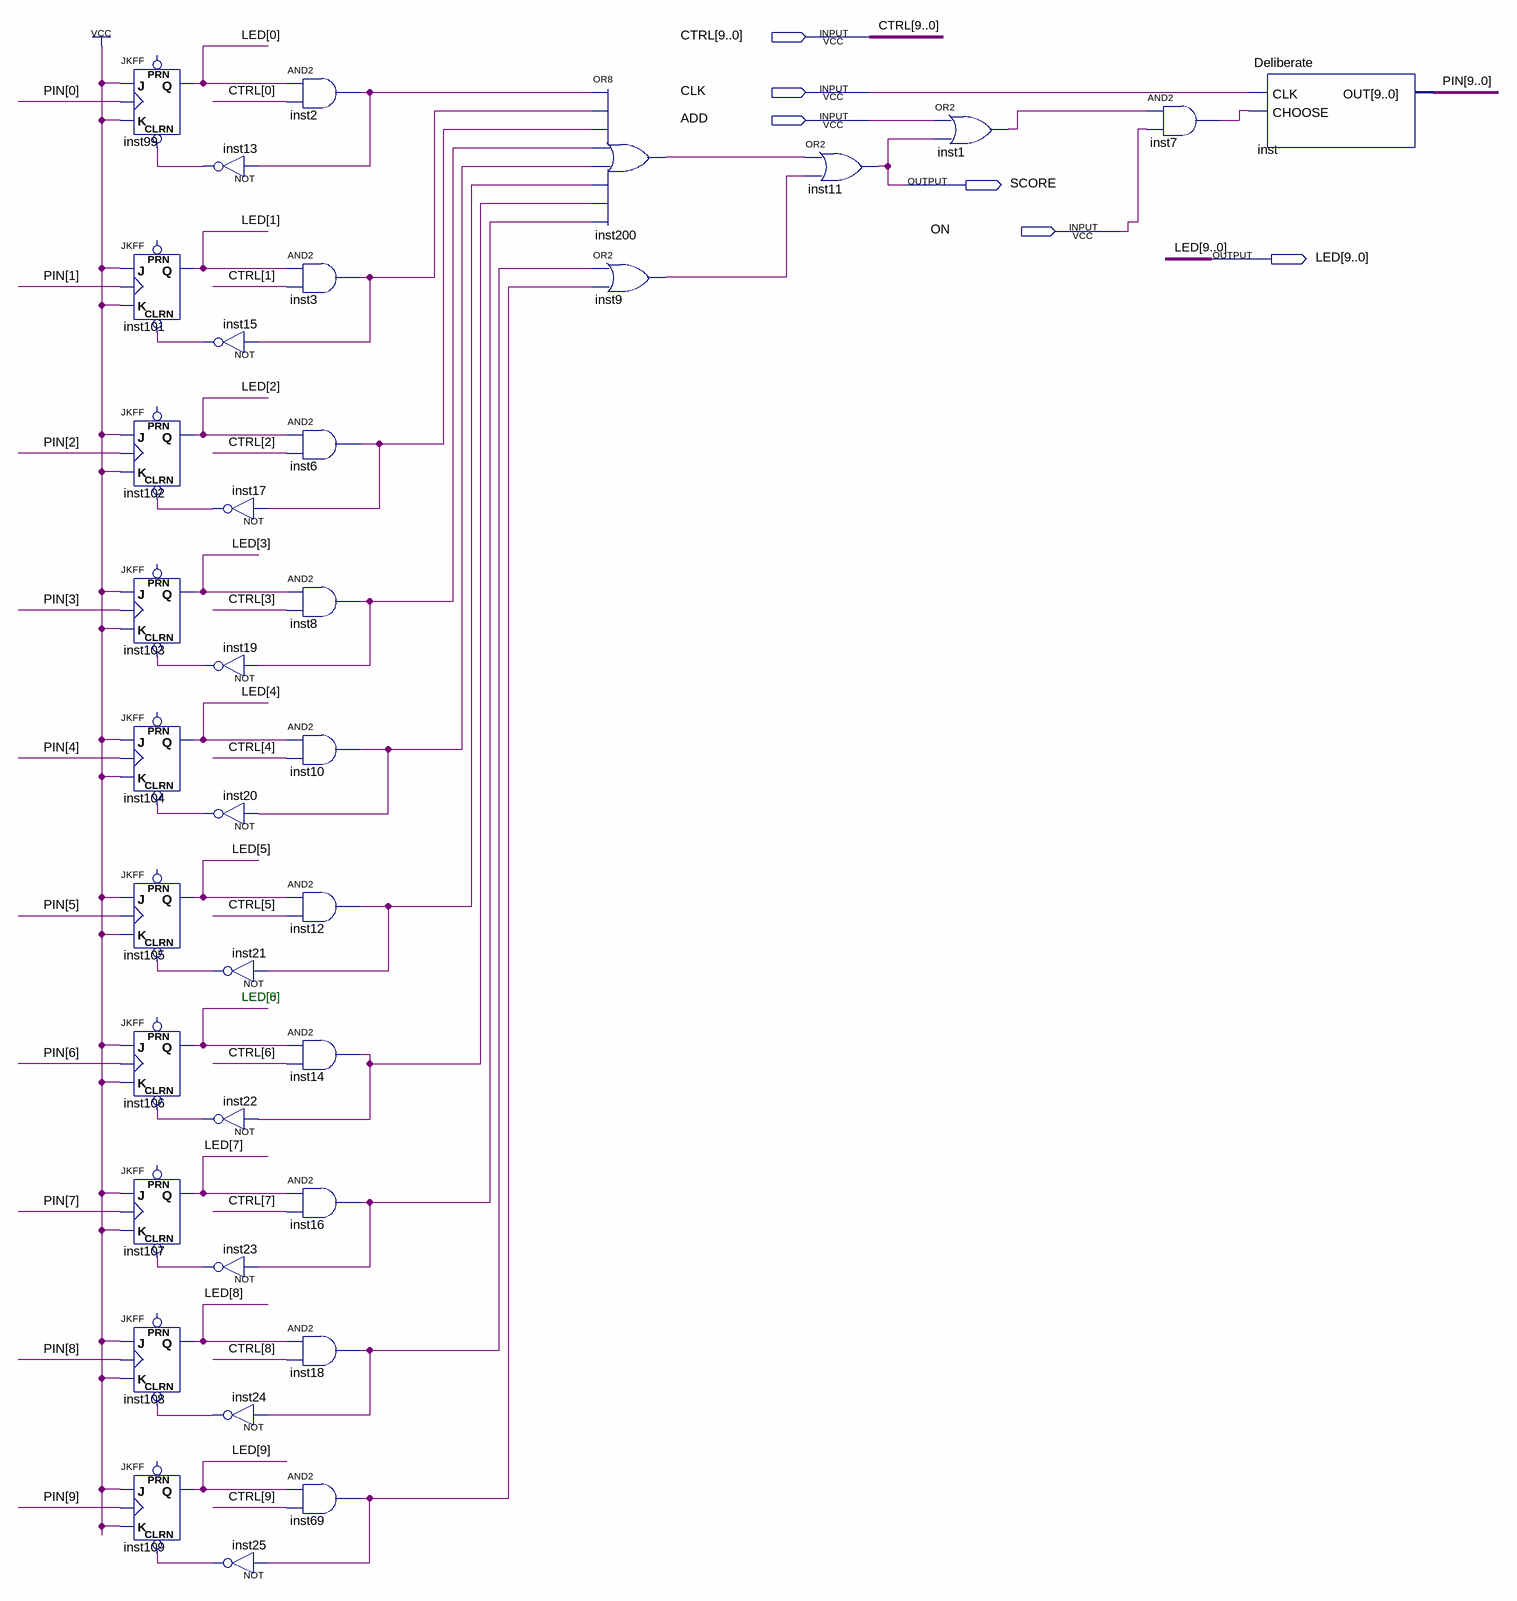
[diagram p0: schematic sheet]
// Quartus schematic Game.bdf as structural Verilog: 36 symbols, 6 pins
module Game (
  input  [9:0] CTRL,
  input  CLK,
  input  ADD,
  input  ON,
  output SCORE,
  output [9:0] LED
);

  wire inst1_out, inst2_out, inst3_out, inst6_out, inst7_out, inst8_out, inst9_out, inst10_out, inst12_out,
       inst13_out, inst14_out, inst15_out, inst16_out, inst17_out, inst18_out, inst19_out, inst20_out,
       inst21_out, inst22_out, inst23_out, inst24_out, inst25_out, inst69_out, inst200_out;
  wire [9:0] PIN;

  JKFF inst99 (.CLRN(inst13_out), .K(1'b1), .J(1'b1), .CLK(PIN[0]), .Q(LED[0]));  // open: PRN
  JKFF inst101 (.CLRN(inst15_out), .K(1'b1), .J(1'b1), .CLK(PIN[1]), .Q(LED[1]));  // open: PRN
  JKFF inst102 (.CLRN(inst17_out), .K(1'b1), .J(1'b1), .CLK(PIN[2]), .Q(LED[2]));  // open: PRN
  JKFF inst103 (.CLRN(inst19_out), .K(1'b1), .J(1'b1), .CLK(PIN[3]), .Q(LED[3]));  // open: PRN
  JKFF inst104 (.CLRN(inst20_out), .K(1'b1), .J(1'b1), .CLK(PIN[4]), .Q(LED[4]));  // open: PRN
  JKFF inst105 (.CLRN(inst21_out), .K(1'b1), .J(1'b1), .CLK(PIN[5]), .Q(LED[5]));  // open: PRN
  JKFF inst106 (.CLRN(inst22_out), .K(1'b1), .J(1'b1), .CLK(PIN[6]), .Q(LED[6]));  // open: PRN
  JKFF inst107 (.CLRN(inst23_out), .K(1'b1), .J(1'b1), .CLK(PIN[7]), .Q(LED[7]));  // open: PRN
  JKFF inst108 (.CLRN(inst24_out), .K(1'b1), .J(1'b1), .CLK(PIN[8]), .Q(LED[8]));  // open: PRN
  JKFF inst109 (.CLRN(inst25_out), .K(1'b1), .J(1'b1), .CLK(PIN[9]), .Q(LED[9]));  // open: PRN
  not inst13 (inst13_out, inst2_out);
  not inst15 (inst15_out, inst3_out);
  not inst17 (inst17_out, inst6_out);
  not inst19 (inst19_out, inst8_out);
  not inst20 (inst20_out, inst10_out);
  not inst21 (inst21_out, inst12_out);
  not inst22 (inst22_out, inst14_out);
  not inst23 (inst23_out, inst16_out);
  not inst24 (inst24_out, inst18_out);
  not inst25 (inst25_out, inst69_out);
  and inst2 (inst2_out, LED[0], CTRL[0]);
  and inst3 (inst3_out, LED[1], CTRL[1]);
  and inst6 (inst6_out, LED[2], CTRL[2]);
  and inst8 (inst8_out, LED[3], CTRL[3]);
  and inst10 (inst10_out, LED[4], CTRL[4]);
  and inst12 (inst12_out, LED[5], CTRL[5]);
  and inst14 (inst14_out, LED[6], CTRL[6]);
  and inst16 (inst16_out, LED[7], CTRL[7]);
  and inst18 (inst18_out, LED[8], CTRL[8]);
  and inst69 (inst69_out, LED[9], CTRL[9]);
  or inst200 (inst200_out, inst2_out, inst3_out, inst6_out, inst8_out, inst10_out, inst12_out, inst14_out, inst16_out);
  or inst9 (inst9_out, inst18_out, inst69_out);
  or inst11 (SCORE, inst200_out, inst9_out);
  or inst1 (inst1_out, ADD, SCORE);
  and inst7 (inst7_out, inst1_out, ON);
  Deliberate inst (.CLK(CLK), .CHOOSE(inst7_out), .OUT(PIN));

  // Notes on the sheet:
  //   LED[0]
endmodule
